# Altium schematic sheet Sheet1.SchDoc
size A1; SheetNumber: 1; SheetTotal: 1
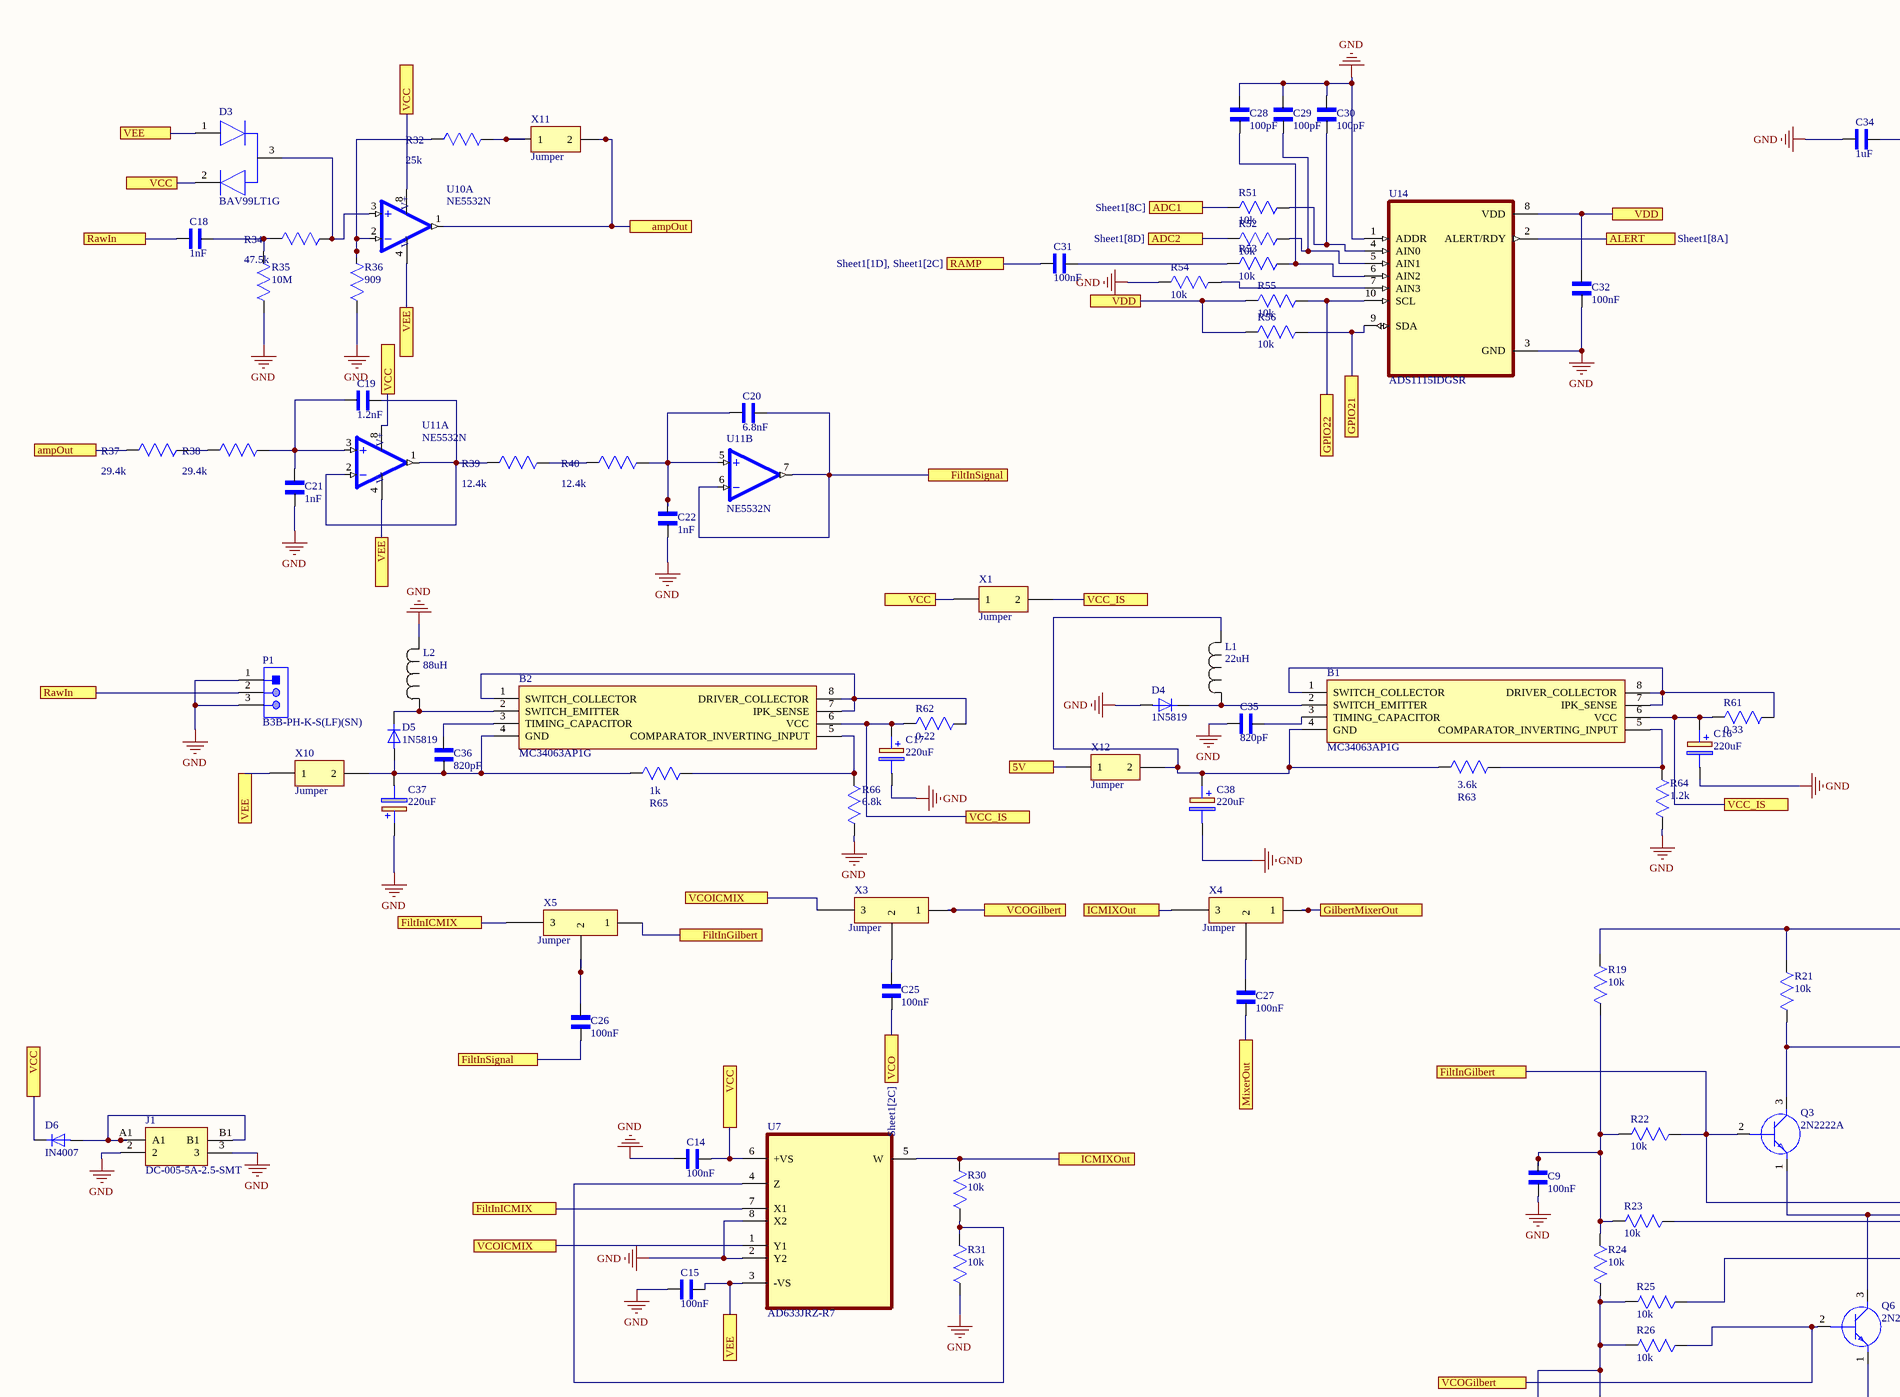
[diagram p0: Sheet1.SchDoc, top left]
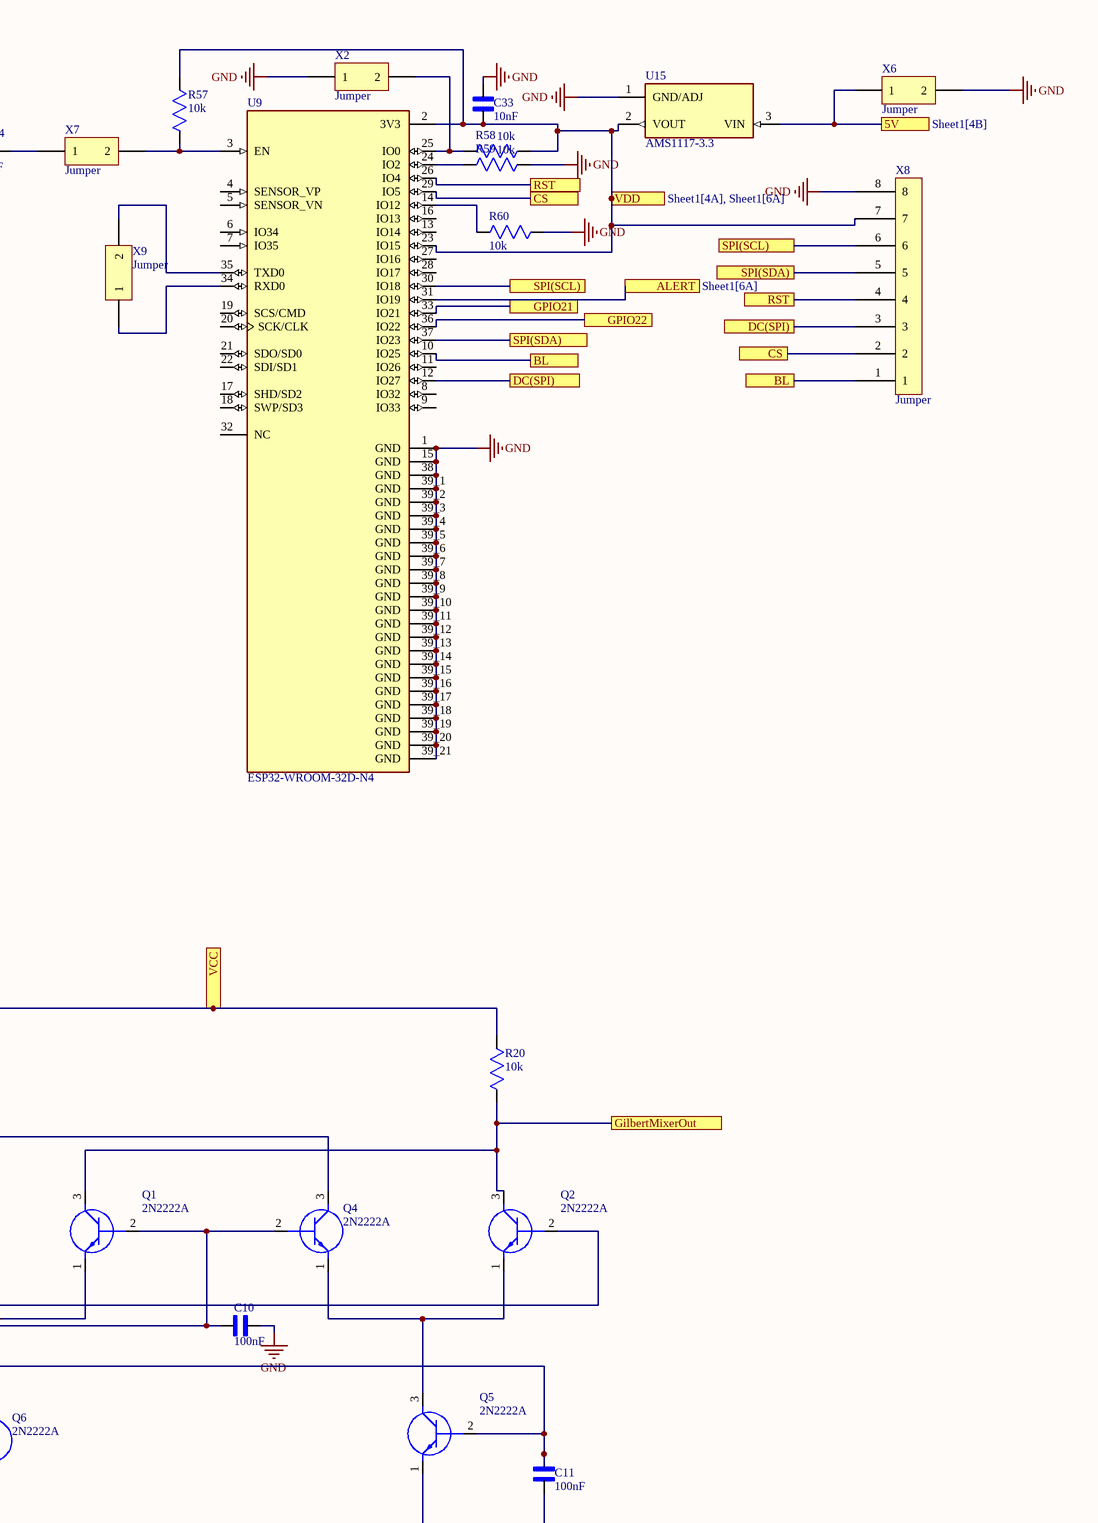
[diagram p1: Sheet1.SchDoc, top right]
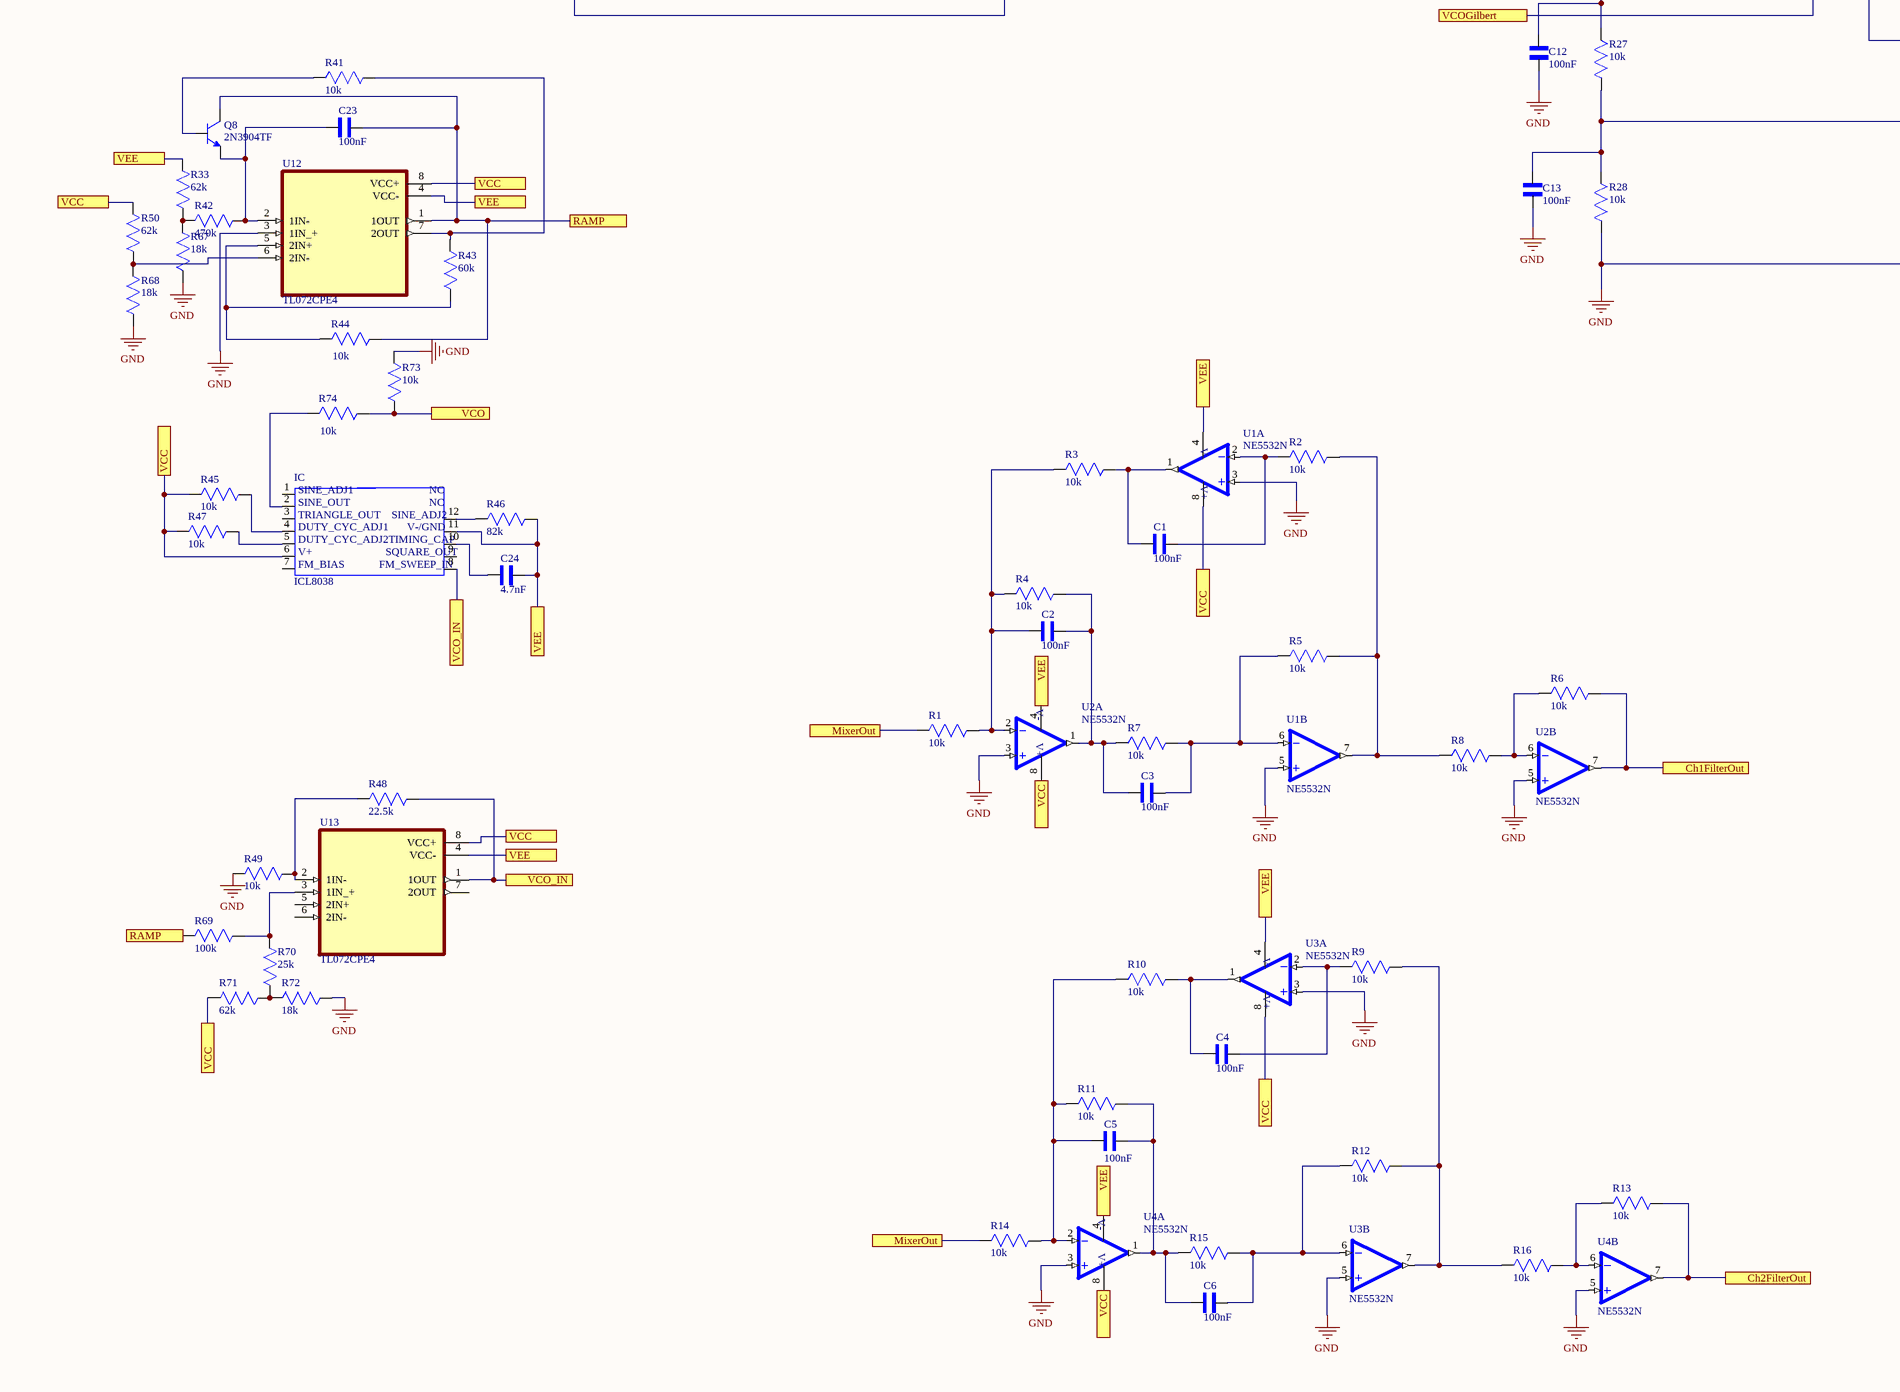
[diagram p2: Sheet1.SchDoc, bottom left]
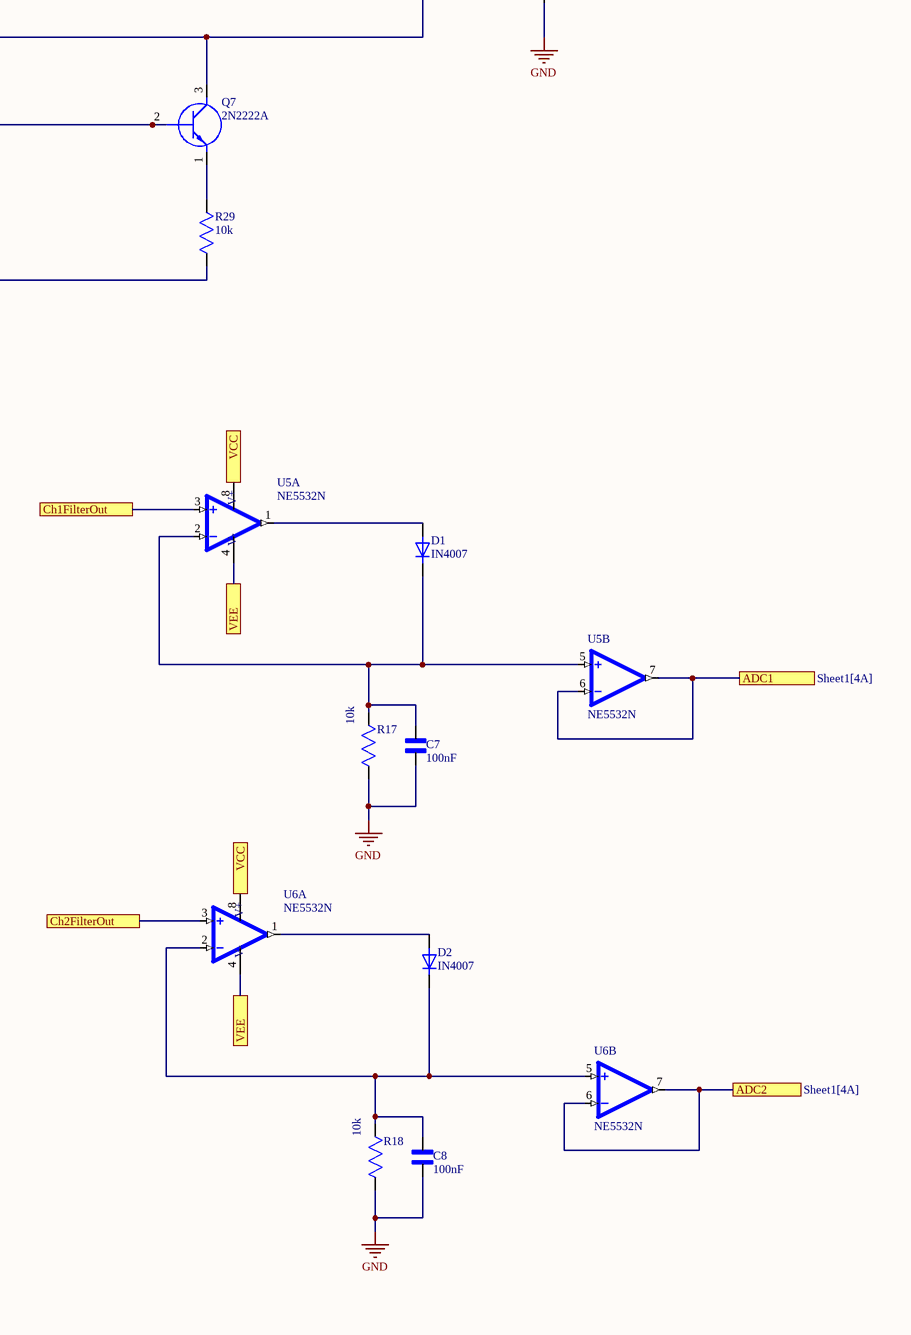
[diagram p3: Sheet1.SchDoc, bottom right]

## Parts
B1  MC34063AP1G  [DIP794W56P254L959H533Q8N]
B2  MC34063AP1G  [DIP794W56P254L959H533Q8N]
C1  100nF  [CAPC2012X95N]
C2  100nF  [CAPC2012X95N]
C3  100nF  [CAPC2012X95N]
C4  100nF  [CAPC2012X95N]
C5  100nF  [CAPC2012X95N]
C6  100nF  [CAPC2012X95N]
C7  100nF  [CAPC2012X95N]
C8  100nF  [CAPC2012X95N]
C9  100nF  [CAPC2012X95N]
C10  100nF  [CAPC2012X95N]
C11  100nF  [CAPC2012X95N]
C12  100nF  [CAPC2012X95N]
C13  100nF  [CAPC2012X95N]
C14  100nF  [CAPC2012X95N]
C15  100nF  [CAPC2012X95N]
C16  220uF  [CAPAE660X800N]
C17  220uF  [CAPAE660X800N]
C18  1nF  [CAPC2012X95N]
C19  1.2nF  [CAPC2012X95N]
C20  6.8nF  [CAPC2012X95N]
C21  1nF  [CAPC2012X95N]
C22  1nF  [CAPC2012X95N]
C23  100nF  [CAPC2012X95N]
C24  4.7nF  [CAPC2012X95N]
C25  100nF  [CAPC2012X95N]
C26  100nF  [CAPC2012X95N]
C27  100nF  [CAPC2012X95N]
C28  100pF  [CAPC2012X95N]
C29  100pF  [CAPC2012X95N]
C30  100pF  [CAPC2012X95N]
C31  100nF  [CAPC2012X95N]
C32  100nF  [CAPC2012X95N]
C33  10nF  [CAPC2012X95N]
C34  1uF  [CAPC2012X95N]
C35  820pF  [CAPC2012X95N]
C36  820pF  [CAPC2012X95N]
C37  220uF  [CAPAE660X800N]
C38  220uF  [CAPAE660X800N]
D1  IN4007  [DIOAD1070W78L470D235P]
D2  IN4007  [DIOAD1070W78L470D235P]
D3  BAV99LT1G  [FP-318-08-IPC_B]
D4  1N5819  [DIOAD1070W78L470D235P]
D5  1N5819  [DIOAD1070W78L470D235P]
D6  IN4007  [DIOAD1070W78L470D235P]
IC  ICL8038  [ICL8038]
J1  DC-005-5A-2.5-SMT  [DC0055A25SMT]
L1  22uH  [IND_BOURNS_SRN6045]
L2  88uH  [IND_BOURNS_SRN6045]
P1  B3B-PH-K-S(LF)(SN)  [JST-B3B-PH-K-S-3_V]
Q1  2N2222A  [2N2222A]
Q2  2N2222A  [2N2222A]
Q3  2N2222A  [2N2222A]
Q4  2N2222A  [2N2222A]
Q5  2N2222A  [2N2222A]
Q6  2N2222A  [2N2222A]
Q7  2N2222A  [2N2222A]
Q8  2N3904TF  [TO92254P520H877-3]
R1  10k  [RC0805N_YAG-M]
R2  10k  [RC0805N_YAG-M]
R3  10k  [RC0805N_YAG-M]
R4  10k  [RC0805N_YAG-M]
R5  10k  [RC0805N_YAG-M]
R6  10k  [RC0805N_YAG-M]
R7  10k  [RC0805N_YAG-M]
R8  10k  [RC0805N_YAG-M]
R9  10k  [RC0805N_YAG-M]
R10  10k  [RC0805N_YAG-M]
R11  10k  [RC0805N_YAG-M]
R12  10k  [RC0805N_YAG-M]
R13  10k  [RC0805N_YAG-M]
R14  10k  [RC0805N_YAG-M]
R15  10k  [RC0805N_YAG-M]
R16  10k  [RC0805N_YAG-M]
R17  10k  [RC0805N_YAG-M]
R18  10k  [RC0805N_YAG-M]
R19  10k  [RC0805N_YAG-M]
R20  10k  [RC0805N_YAG-M]
R21  10k  [RC0805N_YAG-M]
R22  10k  [RC0805N_YAG-M]
R23  10k  [RC0805N_YAG-M]
R24  10k  [RC0805N_YAG-M]
R25  10k  [RC0805N_YAG-M]
R26  10k  [RC0805N_YAG-M]
R27  10k  [RC0805N_YAG-M]
R28  10k  [RC0805N_YAG-M]
R29  10k  [RC0805N_YAG-M]
R30  10k  [RC0805N_YAG-M]
R31  10k  [RC0805N_YAG-M]
R32  25k  [RC0805N_YAG-M]
R33  62k  [RC0805N_YAG-M]
R34  47.5k  [RC0805N_YAG-M]
R35  10M  [RC0805N_YAG-M]
R36  909  [RC0805N_YAG-M]
R37  29.4k  [RC0805N_YAG-M]
R38  29.4k  [RC0805N_YAG-M]
R39  12.4k  [RC0805N_YAG-M]
R40  12.4k  [RC0805N_YAG-M]
R41  10k  [RC0805N_YAG-M]
R42  470k  [RC0805N_YAG-M]
R43  60k  [RC0805N_YAG-M]
R44  10k  [RC0805N_YAG-M]
R45  10k  [RC0805N_YAG-M]
R46  82k  [RC0805N_YAG-M]
R47  10k  [RC0805N_YAG-M]
R48  22.5k  [RC0805N_YAG-M]
R49  10k  [RC0805N_YAG-M]
R50  62k  [RC0805N_YAG-M]
R51  10k  [RC0805N_YAG-M]
R52  10k  [RC0805N_YAG-M]
R53  10k  [RC0805N_YAG-M]
R54  10k  [RC0805N_YAG-M]
R55  10k  [RC0805N_YAG-M]
R56  10k  [RC0805N_YAG-M]
R57  10k  [RC0805N_YAG-M]
R58  10k  [RC0805N_YAG-M]
R59  10k  [RC0805N_YAG-M]
R60  10k  [RC0805N_YAG-M]
R61  0.33  [RES_BPR56_5W_10MM_VERTICAL.]
R62  0.22  [RES_BPR56_5W_10MM_VERTICAL.]
R63  3.6k  [RC0805N_YAG-M]
R64  1.2k  [RC0805N_YAG-M]
R65  1k  [RC0805N_YAG-M]
R66  6.8k  [RC0805N_YAG-M]
R67  18k  [RC0805N_YAG-M]
R68  18k  [RC0805N_YAG-M]
R69  100k  [RC0805N_YAG-M]
R70  25k  [RC0805N_YAG-M]
R71  62k  [RC0805N_YAG-M]
R72  18k  [RC0805N_YAG-M]
R73  10k  [RC0805N_YAG-M]
R74  10k  [RC0805N_YAG-M]
U1  NE5532N  [DIP766W45P254L1016H533Q8]  (parts A,B of 2)
U2  NE5532N  [DIP766W45P254L1016H533Q8]  (parts A,B of 2)
U3  NE5532N  [DIP766W45P254L1016H533Q8]  (parts A,B of 2)
U4  NE5532N  [DIP766W45P254L1016H533Q8]  (parts A,B of 2)
U5  NE5532N  [DIP766W45P254L1016H533Q8]  (parts A,B of 2)
U6  NE5532N  [DIP766W45P254L1016H533Q8]  (parts A,B of 2)
U7  AD633JRZ-R7  [SOIC127P600X175-8N]
U9  ESP32-WROOM-32D-N4  [MODULE_ESP32-WROOM-32D-N4]
U10  NE5532N  [DIP766W45P254L1016H533Q8]  (part A of 2)
U11  NE5532N  [DIP766W45P254L1016H533Q8]  (parts A,B of 2)
U12  TL072CPE4  [DIP794W45P254L959H508Q8]
U13  TL072CPE4  [DIP794W45P254L959H508Q8]
U14  ADS1115IDGSR  [SOP50P490X110-10N]
U15  AMS1117-3.3  [SOT229P700X180-4N]
X1  Jumper  [CON_JUMPER_2POL]
X2  Jumper  [CON_JUMPER_2POL]
X3  Jumper  [CON_JUMPER_3POL]
X4  Jumper  [CON_JUMPER_3POL]
X5  Jumper  [CON_JUMPER_3POL]
X6  Jumper  [CON_JUMPER_2POL]
X7  Jumper  [CON_JUMPER_2POL]
X8  Jumper  [CON_JUMPER_8POL_LINEAR]
X9  Jumper  [CON_JUMPER_2POL]
X10  Jumper  [CON_JUMPER_2POL]
X11  Jumper  [CON_JUMPER_2POL]
X12  Jumper  [CON_JUMPER_2POL]

## Ports
5V (see Sheet1[4B]), 5V (see Sheet1[9A]), ADC1 (see Sheet1[4A]), ADC1 (see Sheet1[8C]), ADC2 (see Sheet1[4A]), ADC2 (see Sheet1[8D]), ALERT (see Sheet1[6A]), ALERT (see Sheet1[8A]), ampOut (see Sheet1[1A]), ampOut (see Sheet1[3A]), BL (see Sheet1[8A]), Ch1FilterOut (see Sheet1[6D]), Ch1FilterOut (see Sheet1[7C]), Ch2FilterOut (see Sheet1[6D]), Ch2FilterOut (see Sheet1[7D]), CS (see Sheet1[8A]), DC(SPI) (see Sheet1[8A]), FiltInGilbert (see Sheet1[3B]), FiltInGilbert (see Sheet1[5B]), FiltInICMIX (see Sheet1[2B]), FiltInSignal (see Sheet1[2B]), FiltInSignal (see Sheet1[4A]), GilbertMixerOut (see Sheet1[5B]), GilbertMixerOut (see Sheet1[8B]), GPIO21 (see Sheet1[5A]), GPIO21 (see Sheet1[8A]), GPIO22 (see Sheet1[5A]), GPIO22 (see Sheet1[8A]), ICMIXOut (see Sheet1[4B]), MixerOut (see Sheet1[3D]), MixerOut (see Sheet1[3D], Sheet1[4B]), RAMP (see Sheet1[1D], Sheet1[2C]), RAMP (see Sheet1[1D], Sheet1[4A]), RAMP (see Sheet1[2C], Sheet1[4A]), RawIn (see Sheet1[1A]), RST (see Sheet1[8A]), SPI(SCL) (see Sheet1[8A]), SPI(SDA) (see Sheet1[8A]), VCC (see Sheet1[1A], Sheet1[1B], Sheet1[1C], Sheet1[1D], Sheet1[2A], Sheet1[2C], Sheet1[2D], Sheet1[3A], Sheet1[3B], Sheet1[4C], Sheet1[4D], Sheet1[5D], Sheet1[7B], Sheet1[7C]), VCC (see Sheet1[1A], Sheet1[1B], Sheet1[1C], Sheet1[1D], Sheet1[2A], Sheet1[2C], Sheet1[2D], Sheet1[3A], Sheet1[3B], Sheet1[4C], Sheet1[4D], Sheet1[5D], Sheet1[7B], Sheet1[7C], Sheet1[7D]), VCC (see Sheet1[1A], Sheet1[1B], Sheet1[1C], Sheet1[1D], Sheet1[2A], Sheet1[2C], Sheet1[2D], Sheet1[3A], Sheet1[3B], Sheet1[4C], Sheet1[4D], Sheet1[5D], Sheet1[7B], Sheet1[7D]), VCC (see Sheet1[1A], Sheet1[1B], Sheet1[1C], Sheet1[1D], Sheet1[2A], Sheet1[2C], Sheet1[2D], Sheet1[3A], Sheet1[3B], Sheet1[4C], Sheet1[4D], Sheet1[5D], Sheet1[7C], Sheet1[7D]), VCC (see Sheet1[1A], Sheet1[1B], Sheet1[1C], Sheet1[1D], Sheet1[2A], Sheet1[2C], Sheet1[2D], Sheet1[3A], Sheet1[3B], Sheet1[4C], Sheet1[4D], Sheet1[7B], Sheet1[7C], Sheet1[7D]), VCC (see Sheet1[1A], Sheet1[1B], Sheet1[1C], Sheet1[1D], Sheet1[2A], Sheet1[2C], Sheet1[2D], Sheet1[3A], Sheet1[3B], Sheet1[4D], Sheet1[5D], Sheet1[7B], Sheet1[7C], Sheet1[7D]), VCC (see Sheet1[1A], Sheet1[1B], Sheet1[1C], Sheet1[1D], Sheet1[2A], Sheet1[2C], Sheet1[2D], Sheet1[3A], Sheet1[4C], Sheet1[4D], Sheet1[5D], Sheet1[7B], Sheet1[7C], Sheet1[7D]), VCC (see Sheet1[1A], Sheet1[1B], Sheet1[1C], Sheet1[1D], Sheet1[2A], Sheet1[2C], Sheet1[2D], Sheet1[3B], Sheet1[4C], Sheet1[4D], Sheet1[5D], Sheet1[7B], Sheet1[7C], Sheet1[7D]), VCC (see Sheet1[1A], Sheet1[1B], Sheet1[1C], Sheet1[1D], Sheet1[2A], Sheet1[2C], Sheet1[3A], Sheet1[3B], Sheet1[4C], Sheet1[4D], Sheet1[5D], Sheet1[7B], Sheet1[7C], Sheet1[7D]), VCC (see Sheet1[1A], Sheet1[1B], Sheet1[1C], Sheet1[1D], Sheet1[2A], Sheet1[2D], Sheet1[3A], Sheet1[3B], Sheet1[4C], Sheet1[4D], Sheet1[5D], Sheet1[7B], Sheet1[7C], Sheet1[7D]), VCC (see Sheet1[1A], Sheet1[1B], Sheet1[1C], Sheet1[2A], Sheet1[2C], Sheet1[2D], Sheet1[3A], Sheet1[3B], Sheet1[4C], Sheet1[4D], Sheet1[5D], Sheet1[7B], Sheet1[7C], Sheet1[7D]), VCC (see Sheet1[1A], Sheet1[1C], Sheet1[1D], Sheet1[2A], Sheet1[2C], Sheet1[2D], Sheet1[3A], Sheet1[3B], Sheet1[4C], Sheet1[4D], Sheet1[5D], Sheet1[7B], Sheet1[7C], Sheet1[7D]), VCC (see Sheet1[1B], Sheet1[1C], Sheet1[1D], Sheet1[2A], Sheet1[2C], Sheet1[2D], Sheet1[3A], Sheet1[3B], Sheet1[4C], Sheet1[4D], Sheet1[5D], Sheet1[7B], Sheet1[7C], Sheet1[7D]), VCC_IS (see Sheet1[4A], Sheet1[4B]), VCC_IS (see Sheet1[4A], Sheet1[6B]), VCC_IS (see Sheet1[4B], Sheet1[6B]), VCO (see Sheet1[2C]), VCO (see Sheet1[3B]), VCO_IN (see Sheet1[2C]), VCO_IN (see Sheet1[2D]), VCOGilbert (see Sheet1[4B]), VCOGilbert (see Sheet1[5B]), VCOICMIX (see Sheet1[2B]), VCOICMIX (see Sheet1[3B]), VDD (see Sheet1[4A], Sheet1[6A]), VDD (see Sheet1[4A], Sheet1[8A]), VDD (see Sheet1[6A], Sheet1[8A]), VEE (see Sheet1[1A], Sheet1[1B], Sheet1[1C], Sheet1[2A], Sheet1[2C], Sheet1[2D], Sheet1[3B], Sheet1[4C], Sheet1[4D], Sheet1[5D], Sheet1[7C]), VEE (see Sheet1[1A], Sheet1[1B], Sheet1[1C], Sheet1[2A], Sheet1[2C], Sheet1[2D], Sheet1[3B], Sheet1[4C], Sheet1[4D], Sheet1[5D], Sheet1[7C], Sheet1[7D]), VEE (see Sheet1[1A], Sheet1[1B], Sheet1[1C], Sheet1[2A], Sheet1[2C], Sheet1[2D], Sheet1[3B], Sheet1[4C], Sheet1[4D], Sheet1[5D], Sheet1[7D]), VEE (see Sheet1[1A], Sheet1[1B], Sheet1[1C], Sheet1[2A], Sheet1[2C], Sheet1[2D], Sheet1[3B], Sheet1[4C], Sheet1[4D], Sheet1[7C], Sheet1[7D]), VEE (see Sheet1[1A], Sheet1[1B], Sheet1[1C], Sheet1[2A], Sheet1[2C], Sheet1[2D], Sheet1[3B], Sheet1[4C], Sheet1[5D], Sheet1[7C], Sheet1[7D]), VEE (see Sheet1[1A], Sheet1[1B], Sheet1[1C], Sheet1[2A], Sheet1[2C], Sheet1[2D], Sheet1[4C], Sheet1[4D], Sheet1[5D], Sheet1[7C], Sheet1[7D]), VEE (see Sheet1[1A], Sheet1[1B], Sheet1[1C], Sheet1[2A], Sheet1[2C], Sheet1[3B], Sheet1[4C], Sheet1[4D], Sheet1[5D], Sheet1[7C], Sheet1[7D]), VEE (see Sheet1[1A], Sheet1[1B], Sheet1[2A], Sheet1[2C], Sheet1[2D], Sheet1[3B], Sheet1[4C], Sheet1[4D], Sheet1[5D], Sheet1[7C], Sheet1[7D]), VEE (see Sheet1[1A], Sheet1[1C], Sheet1[2A], Sheet1[2C], Sheet1[2D], Sheet1[3B], Sheet1[4C], Sheet1[4D], Sheet1[5D], Sheet1[7C], Sheet1[7D]), VEE (see Sheet1[1B], Sheet1[1C], Sheet1[2A], Sheet1[2C], Sheet1[2D], Sheet1[3B], Sheet1[4C], Sheet1[4D], Sheet1[5D], Sheet1[7C], Sheet1[7D])

## Nets
GND: C7.2 C8.2 C9.2 C10.1 C11.1 C12.2 C13.2 C14.1 C15.1 C16.2(-) C17.2(-) C21.1 C22.1 C28.2 C29.2 C30.2 C32.1 C33.2 C34.2 C35.2 C37.1(+) C38.2(-) D4.A J1.2 J1.3 L2.1 P1.1 P1.3 R17.1 R18.1 R28.1 R29.1 R31.2 R35.2 R36.2 R49.2 R54.2 R59.1 R60.1 R64.1 R66.1 R67.2 R68.2 R72.2 R73.1 U1.3(+INA) U1.5(+INB) U2.3(+INA) U2.5(+INB) U3.3(+INA) U3.5(+INB) U4.3(+INA) U4.5(+INB) U7.2(Y2) U7.8(X2) U9.1(GND) U9.15(GND) U9.38(GND) U9.39_1(GND) U9.39_2(GND) U9.39_3(GND) U9.39_4(GND) U9.39_5(GND) U9.39_6(GND) U9.39_7(GND) U9.39_8(GND) U9.39_9(GND) U9.39_10(GND) U9.39_11(GND) U9.39_12(GND) U9.39_13(GND) U9.39_14(GND) U9.39_15(GND) U9.39_16(GND) U9.39_17(GND) U9.39_18(GND) U9.39_19(GND) U9.39_20(GND) U9.39_21(GND) U12.3(1IN_+) U14.1(ADDR) U14.3(GND) U15.1(GND/ADJ) X2.1 X6.2 X8.8
5V: U15.3(VIN) X6.1 X12.1 ; port 5V
ADC1: R51.2 U5.6(-INB) U5.7(OUTB) ; port ADC1
ADC2: R52.2 U6.6(-INB) U6.7(OUTB) ; port ADC2
ALERT: U9.31(IO19) U14.2(ALERT/RDY) ; port ALERT
ampOut: R37.2 U10.1(OUTA) X11.2 ; port ampOut
BL: U9.10(IO25) X8.1 ; port BL
Ch1FilterOut: R6.1 U2.7(OUTB) U5.3(+INA) ; port Ch1FilterOut
Ch2FilterOut: R13.1 U4.7(OUTB) U6.3(+INA) ; port Ch2FilterOut
CS: U9.29(IO5) X8.2 ; port CS
DC(SPI): U9.12(IO27) X8.3 ; port DC(SPI)
FiltInGilbert: Q2.2(B) Q3.2(B) R22.2 X5.1 ; port FiltInGilbert
FiltInICMIX: U7.7(X1) X5.3 ; port FiltInICMIX
FiltInSignal: C20.2 C26.2 U11.6(-INB) U11.7(OUTB) ; port FiltInSignal
GilbertMixerOut: Q1.3(C) Q2.3(C) R20.1 X4.1 ; port GilbertMixerOut
GPIO21: R56.1 U9.33(IO21) U14.9(SDA) ; port GPIO21
GPIO22: R55.1 U9.36(IO22) U14.10(SCL) ; port GPIO22
ICMIXOut: R30.1 U7.5(W) X4.3 ; port ICMIXOut
MixerOut: C27.2 R1.2 R14.2 ; port MixerOut
RAMP: C23.2 C31.1 Q8.3(C) R44.1 R69.2 U12.1(1OUT) ; port RAMP
RawIn: C18.2 P1.2 ; port RawIn
RST: U9.26(IO4) X8.4 ; port RST
SPI(SCL): U9.30(IO18) X8.6 ; port SPI(SCL)
SPI(SDA): U9.37(IO23) X8.5 ; port SPI(SDA)
VCC: C14.2 D3.2(C) D6.C IC.6 R19.2 R20.2 R21.2 R45.2 R47.2 R50.1 R71.1 U1.8(V+) U2.8(V+) U3.8(V+) U4.8(V+) U5.8(V+) U6.8(V+) U7.6(+VS) U10.8(V+) U11.8(V+) U12.8(VCC+) U13.8(VCC+) X1.1 ; port VCC
VCC_IS: B1.6(VCC) B2.6(VCC) C16.1(+) C17.1(+) R61.2 R62.2 X1.2 ; port VCC_IS
VCO: C25.2 R73.2 R74.1 ; port VCO
VCO_IN: IC.8 R48.1 U13.1(1OUT) ; port VCO_IN
VCOGilbert: Q6.2(B) R26.2 X3.1 ; port VCOGilbert
VCOICMIX: U7.1(Y1) X3.3 ; port VCOICMIX
VDD: C32.2 C33.1 R55.2 R56.2 R57.1 R58.1 U9.2(3V3) U9.23(IO15) U14.8(VDD) U15.2(VOUT) X8.7 ; port VDD
VEE: C15.2 C24.2 D3.1(A) IC.11 R33.1 R46.1 U1.4(V-) U2.4(V-) U3.4(V-) U4.4(V-) U5.4(V-) U6.4(V-) U7.3(-VS) U10.4(V-) U11.4(V-) U12.4(VCC-) U13.4(VCC-) X10.1 ; port VEE
NetB1_1: B1.1(SWITCH_COLLECTOR) B1.7(IPK_SENSE) B1.8(DRIVER_COLLECTOR) R61.1
NetB1_2: B1.2(SWITCH_EMITTER) D4.C L1.2
NetB1_3: B1.3(TIMING_CAPACITOR) C35.1
NetB1_4: B1.4(GND) C38.1(+) L1.1 R63.2 X12.2
NetB1_5: B1.5(COMPARATOR_INVERTING_INPUT) R63.1 R64.2
NetB2_1: B2.1(SWITCH_COLLECTOR) B2.7(IPK_SENSE) B2.8(DRIVER_COLLECTOR) R62.1
NetB2_2: B2.2(SWITCH_EMITTER) D5.C L2.2
NetB2_3: B2.3(TIMING_CAPACITOR) C36.1
NetB2_4: B2.4(GND) C36.2 C37.2(-) D5.A R65.2 X10.2
NetB2_5: B2.5(COMPARATOR_INVERTING_INPUT) R65.1 R66.2
NetC1_1: C1.1 R3.1 U1.1(OUTA)
NetC1_2: C1.2 R2.2 U1.2(-INA)
NetC2_1: C2.1 R1.1 R3.2 R4.2 U2.2(-INA)
NetC2_2: C2.2 C3.1 R4.1 R7.2 U2.1(OUTA)
NetC3_2: C3.2 R5.2 R7.1 U1.6(-INB)
NetC4_1: C4.1 R10.1 U3.1(OUTA)
NetC4_2: C4.2 R9.2 U3.2(-INA)
NetC5_1: C5.1 R10.2 R11.2 R14.1 U4.2(-INA)
NetC5_2: C5.2 C6.1 R11.1 R15.2 U4.1(OUTA)
NetC6_2: C6.2 R12.2 R15.1 U3.6(-INB)
NetC7_1: C7.1 D1.C R17.2 U5.2(-INA) U5.5(+INB)
NetC8_1: C8.1 D2.C R18.2 U6.2(-INA) U6.5(+INB)
NetC9_1: C9.1 R19.1 R22.1 R23.1 R24.2
NetC10_2: C10.2 Q1.2(B) Q4.2(B) R23.2
NetC11_2: C11.2 Q5.2(B) R25.2
NetC12_1: C12.1 R24.1 R25.1 R26.1 R27.2
NetC13_1: C13.1 Q7.2(B) R27.1 R28.2
NetC18_1: C18.1 R34.2 R35.1
NetC19_1: C19.1 C21.2 R38.1 U11.3(+INA)
NetC19_2: C19.2 R39.2 U11.1(OUTA) U11.2(-INA)
NetC20_1: C20.1 C22.2 R40.1 U11.5(+INB)
NetC23_1: C23.1 Q8.1(E) R42.1 U12.2(1IN-)
NetC24_1: C24.1 IC.10
NetC25_1: C25.1 X3.2
NetC26_1: C26.1 X5.2
NetC27_1: C27.1 X4.2
NetC28_1: C28.1 R53.1 U14.6(AIN2)
NetC29_1: C29.1 R52.1 U14.5(AIN1)
NetC30_1: C30.1 R51.1 U14.4(AIN0)
NetC31_2: C31.2 R53.2
NetC34_1: C34.1 X7.1
NetD1_A: D1.A U5.1(OUTA)
NetD2_A: D2.A U6.1(OUTA)
NetD3_3: D3.3(CATHODE/ANODE) R34.1 U10.3(+INA)
NetD6_A: D6.A J1.A1 J1.B1
NetIC_2: IC.2 R74.2
NetIC_4: IC.4 R45.1
NetIC_5: IC.5 R47.1
NetIC_12: IC.12 R46.2
NetQ1_1: Q1.1(E) Q3.1(E) Q6.3(C)
NetQ2_1: Q2.1(E) Q4.1(E) Q5.3(C)
NetQ3_3: Q3.3(C) Q4.3(C) R21.1
NetQ5_1: Q5.1(E) Q6.1(E) Q7.3(C)
NetQ7_1: Q7.1(E) R29.2
NetQ8_2: Q8.2(B) R41.2
NetR2_1: R2.1 R5.1 R8.2 U1.7(OUTB)
NetR6_2: R6.2 R8.1 U2.6(-INB)
NetR9_1: R9.1 R12.1 R16.2 U3.7(OUTB)
NetR13_2: R13.2 R16.1 U4.6(-INB)
NetR30_2: R30.2 R31.1 U7.4(Z)
NetR32_1: R32.1 X11.1
NetR32_2: R32.2 R36.1 U10.2(-INA)
NetR33_2: R33.2 R42.2 R67.1
NetR37_1: R37.1 R38.2
NetR39_1: R39.1 R40.2
NetR41_1: R41.1 R43.1 U12.7(2OUT)
NetR43_2: R43.2 R44.2 U12.5(2IN+)
NetR48_2: R48.2 R49.1 U13.2(1IN-)
NetR50_2: R50.2 R68.1 U12.6(2IN-)
NetR54_1: R54.1 U14.7(AIN3)
NetR57_2: R57.2 U9.3(EN) X7.2
NetR58_2: R58.2 U9.25(IO0) X2.2
NetR59_2: R59.2 U9.24(IO2)
NetR60_2: R60.2 U9.14(IO12)
NetR69_1: R69.1 R70.1 U13.3(1IN_+)
NetR70_2: R70.2 R71.2 R72.1
NetU9_34: U9.34(RXD0) X9.1
NetU9_35: U9.35(TXD0) X9.2

Not connected (* = marked no-connect by the designer): IC 1 3 7 9; U9 4(SENSOR_VP) 5(SENSOR_VN) 6(IO34) 7(IO35) 8(IO32) 9(IO33) 11(IO26) 13(IO14) 16(IO13) 17(SHD/SD2) 18(SWP/SD3) 19(SCS/CMD) 20(SCK/CLK) 21(SDO/SD0) 22(SDI/SD1) 27(IO16) 28(IO17) 32(NC); U13 5(2IN+) 6(2IN-) 7(2OUT)

## Notes on the sheet
- (in symbol ICL8038) SINE_ADJ1; NC; SINE_OUT; TRIANGLE_OUT; SINE_ADJ2; DUTY_CYC_ADJ1; V-/GND; DUTY_CYC_ADJ2; TIMING_CAP; V+; SQUARE_OUT; FM_BIAS; FM_SWEEP_IN

## Library data of the parts
B1 B2 = MC34063AP1G: Low Standby Current; Output Voltage Adjustable; Precision 2% Reference; Operation from 3.0 V to 40 V Input; Current Limiting; Frequency Operation to 100 kHz; Output Switch Current to 1.5 A; MC34063A = 0 to +70; MC33063A = -40 to +85; MC33063AV / NCV33063A = -40 to +125; 4x4mm DFN package option; Manufacturer_Name: onsemi; Geometry.Height: 5.33mm; Manufacturer_Part_Number: MC34063AP1G; Mouser Part Number: 863-MC34063AP1G; Mouser Price/Stock: https://www.mouser.co.uk/ProductDetail/onsemi/MC34063AP1G?qs=dFKnUM%2FquJaLwjzEV8VjCA%3D%3D; Arrow Part Number: MC34063AP1G; Arrow Price/Stock: https://www.arrow.com/en/products/mc34063ap1g/on-semiconductor?utm_currency=USD&region=europe; Datasheet Link: https://www.onsemi.com/pub/Collateral/MC34063A-D.PDF
C1-C15 C18-C27 = CAP_0805_GENERIC: 0.1 ÂµF Â±10% 50V Ceramic Capacitor X7R 0805 (2012 Metric); MF: Samsung Electro-Mechanics; MP: CL21B104KBCNNNC; SnapEDA_Link: https://www.snapeda.com/parts/CL21B104KBCNNNC/Samsung/view-part/?ref=snap; Package: SMD-2 Samsung; Check_prices: https://www.snapeda.com/parts/CL21B104KBCNNNC/Samsung/view-part/?ref=eda; Voltage: 50V
  C1-C15 C23 C25-C27: Value: 100nF
  C18 C21 C22: Value: 1nF
  C19: Value: 1.2nF
  C20: Value: 6.8nF
  C24: Value: 4.7nF
C16 C17 C37 C38 = UUD1C221MCL1GS: Nichicon 220uF 16 V Aluminium Electrolytic Capacitor, UD Series 2000h 6.3 Dia. x 7.7mm; Geometry.Height: 8mm; Manufacturer_Name: Nichicon; Manufacturer_Part_Number: UUD1C221MCL1GS; Mouser Part Number: 647-UUD1C221MCL; Mouser Price/Stock: https://www.mouser.co.uk/ProductDetail/Nichicon/UUD1C221MCL1GS?qs=BJlw7L4Cy78LNN5S2Zav%252BA%3D%3D; Arrow Part Number: UUD1C221MCL1GS; Arrow Price/Stock: https://www.arrow.com/en/products/uud1c221mcl1gs/nichicon?utm_currency=USD&region=nac; Datasheet Link: http://www.mouser.com/datasheet/2/293/e-uud-1513238.pdf
C28-C32 = CAP_0805_GENERIC: 0.1 ÂµF Â±10% 50V Ceramic Capacitor X7R 0805 (2012 Metric); Value: 1nF; MF: Samsung Electro-Mechanics; MP: CL21B104KBCNNNC; Package: SMD-2 Samsung; SnapEDA_Link: https://www.snapeda.com/parts/CL21B104KBCNNNC/Samsung/view-part/?ref=snap; Check_prices: https://www.snapeda.com/parts/CL21B104KBCNNNC/Samsung/view-part/?ref=eda; Voltage: 50V
C33-C36 = CAP_0805_GENERIC: 0.1 ÂµF Â±10% 50V Ceramic Capacitor X7R 0805 (2012 Metric); Value: 100nF; MF: Samsung Electro-Mechanics; MP: CL21B104KBCNNNC; SnapEDA_Link: https://www.snapeda.com/parts/CL21B104KBCNNNC/Samsung/view-part/?ref=snap; Package: SMD-2 Samsung; Check_prices: https://www.snapeda.com/parts/CL21B104KBCNNNC/Samsung/view-part/?ref=eda; Voltage: 50V
D1 D2 D4-D6 = IN4007: Diode Standard 1000 V 1A Through Hole DO-204AL (DO-41); MF: Vishay Semiconductor; SnapEDA_Link: https://www.snapeda.com/parts/IN4007/Vishay/view-part/?ref=snap; Package: DO-41 Vishay Semiconductor; Value: *; MP: IN4007; Check_prices: https://www.snapeda.com/parts/IN4007/Vishay/view-part/?ref=eda
D3 = CMP-07163-000036-1: DIODE ARRAY 100V 215MA SOT23-3; Capacitance: 1.5pF; Current Rating: 200mA; Max Repetitive Reverse Voltage (Vrrm): 70V; Forward Voltage: 1.25V; Max Forward Surge Current (Ifsm): 500mA; Peak Reverse Current: 2.5uA; Forward Current: 150mA; Peak Non-Repetitive Surge Current: 2A; Reverse Recovery Time: 6ns; Length: 2.9mm; Voltage Rating (DC): 70V; Case/Package: SOT-23; Height: 0.94mm; Number of Pins: 3; Mount: Surface Mount; Min Operating Temperature: -65°C; Lead Free: Lead Free; REACH SVHC: No SVHC; Width: 1.3mm; Packaging: Tape and Reel; Max Operating Temperature: 150°C
IC = ICL8038: IC OSCILL GEN/VOLT CONTROL 14DIP; MF: Renesas Electronics; Value: *; Price: None; MP: ICL8038; Availability: Unavailable; SnapEDA_Link: https://www.snapeda.com/parts/ICL8038/Renesas%20Electronics%20America%20Inc./view-part/1764984/?ref=snap; Package: None
J1 = DC-005-5A-2.5-SMT: DC Power Jack; Manufacturer_Name: XKB Connectivity; Geometry.Height: 11mm; Manufacturer_Part_Number: DC-005-5A-2.5-SMT; Mouser Part Number: *; Mouser Price/Stock: *; Arrow Part Number: *; Arrow Price/Stock: *; Datasheet Link: https://datasheet.lcsc.com/szlcsc/XKB-DC-005-5A-2-5-SMT_C319133.pdf
L1 L2 = IND_SRN6045_GENERIC: Description; Manufacturer_Name: Bourns Electronics; Manufacturer_Part_Number: SRN6045-100M; Value: 10uH; Current: 3A; Copyright: Copyright (C) 2026 Ultra Librarian. All rights reserved.
P1 = CMP-2000-05164-1: Male Header, Pitch 2 mm, 1 x 3 Position, Height 6 mm, Tail Length 3.4 mm, -25 to 85 degC, RoHS, Bulk; Manufacturer: JST; Style/Orientation: StraightHeader/Plug; Pitch: 2mm; No of Positions: 3; Termination: Crimp; Manufacturer URL: http://www.jst.com/home2.html; Datasheet Version: Oct-06; Type: ShroudedHeader; Datasheet URL: https://datasheet.ciiva.com/11746/0900766b80826550-11746939.pdf
Q1-Q7 = 2N2222A: Transistor BJT NPN; Manufacturer_Name: Diotec; Datasheet Link: https://diotec.com/request/datasheet/2n2222a.pdf; Height: 7.5mm; Manufacturer_Part_Number: 2N2222A; Mouser Part Number: 637-2N2222A; Mouser Price/Stock: https://www.mouser.co.uk/ProductDetail/Diotec-Semiconductor/2N2222A?qs=OlC7AqGiEDmNlRSTGL2dYg%3D%3D; Arrow Part Number: 2N2222A; Arrow Price/Stock: https://www.arrow.com/en/products/2n2222a/diotec-semiconductor-ag
Q8 = 2N3904TF: Transistor General Purpose BJT NPN 40 Volt 0.2 Amp 3-Pin TO-92 Tape And Reel; MF: Fairchild Semiconductor; SnapEDA_Link: https://www.snapeda.com/parts/2N3904TF/Fairchild+Imaging/view-part/?ref=snap; Package: TO-92-3 ON Semiconductor; Value: *; MP: 2N3904TF; Check_prices: https://www.snapeda.com/parts/2N3904TF/Fairchild+Imaging/view-part/?ref=eda
R1-R32 R34-R49 R51-R60 R69 R73 R74 = RES_0805_GENERIC_1: Description; Manufacturer_Name: Yageo; Manufacturer_Part_Number: RC0805FR-0710KL; Copyright: Copyright (C) 2025 Ultra Librarian. All rights reserved.
  R1-R31 R41 R44 R45 R47 R49 R51-R60 R73 R74: Value: 10k
  R32: Value: 25k
  R34: Value: 47.5k
  R35: Value: 10M
  R36: Value: 909
  R37 R38: Value: 29.4k
  R39 R40: Value: 12.4k
  R42: Value: 470k
  R43: Value: 60k
  R46: Value: 82k
  R48: Value: 22.5k
  R69: Value: 100k
R33 R50 R67 R68 R70-R72 = RES_0805_GENERIC_1: Description; Manufacturer_Name: Yageo; Manufacturer_Part_Number: RC0805FR-0710KL; Value: 10k; Copyright: Copyright (C) 2025 Ultra Librarian. All rights reserved.
R61 R62 = RES_BPR56_5W_10MM_VERTICAL: Description; Manufacturer_Name: Yageo; Manufacturer_Part_Number: RC0805FR-0710KL; Value: 10k; Copyright: Copyright (C) 2025 Ultra Librarian. All rights reserved.
R63-R66 = RES_0805_GENERIC_1: Description; Manufacturer_Name: Yageo; Manufacturer_Part_Number: RC0805FR-0710KL; Value: 12.4k; Copyright: Copyright (C) 2025 Ultra Librarian. All rights reserved.
U1-U6 U10 U11 = NE5532N: IC, OP AMP, DUAL; No. of Amplifiers: 2 Amplifier; Bandwidth: 10MHz; Slew Rate: 8V/Âµs; Supply Voltage Range: Â± 15V; Amplifier Case Style: DIP; No. of Pins: 8Pins; Operating Temperature Min: 0Â°C; Operating Temperature Max: 70Â°C; MSL: -; SVHC: No SVHC (1; MF: Fairchild Semiconductor; SnapEDA_Link: https://www.snapeda.com/parts/NE5532N/Fairchild+Imaging/view-part/?ref=snap; Package: PDIP-8 ON Semiconductor; Value: *; MP: NE5532N; Check_prices: https://www.snapeda.com/parts/NE5532N/Fairchild+Imaging/view-part/?ref=eda
U7 = AD633JRZ-R7: Analog Multiplier 4-Quadrant 8-SOIC; MF: Analog Devices; MP: AD633AR; SnapEDA_Link: https://www.snapeda.com/parts/AD633AR/Analog+Devices/view-part/?ref=snap; Package: SOIC-8 Analog Devices; Value: *; Check_prices: https://www.snapeda.com/parts/AD633AR/Analog+Devices/view-part/?ref=eda
U9 = ESP32-WROOM-32D-N4: Bluetooth, WiFi 802.11b/g/n, Bluetooth v4.2 +EDR, Class 1, 2 and 3 Transceiver Module 2.4GHz ~ 2.5GHz Integrated, Trace Surface Mount; MF: Espressif Systems; SnapEDA_Link: https://www.snapeda.com/parts/ESP32-WROOM-32D-N4/Espressif+Systems/view-part/?ref=snap; Package: Non Standard Espressif Systems; Value: *; MP: ESP32-WROOM-32D-N4; Check_prices: https://www.snapeda.com/parts/ESP32-WROOM-32D-N4/Espressif+Systems/view-part/?ref=eda
U12 U13 = TL072CPE4: Dual Low-Noise JFET-Input General-Purpose Operational Amplifier 8-PDIP 0 to 70; MF: Texas Instruments; SnapEDA_Link: https://www.snapeda.com/parts/TL072CPE4/Texas+Instruments/view-part/?ref=snap; Package: PDIP-8 Texas; Value: *; MP: TL072CPE4; Check_prices: https://www.snapeda.com/parts/TL072CPE4/Texas+Instruments/view-part/?ref=eda
U14 = ADS1115IDGSR: 16-bit, 860-SPS, 4-channel, delta-sigma ADC with PGA, oscillator, VREF, comparator and I2C; MF: Texas Instruments; SnapEDA_Link: https://www.snapeda.com/parts/ADS1115IDGSR/Texas+Instruments/view-part/?ref=snap; Package: VSSOP-10 Texas Instruments; Value: *; MP: ADS1115IDGSR; Check_prices: https://www.snapeda.com/parts/ADS1115IDGSR/Texas+Instruments/view-part/?ref=eda
U15 = AMS1117-3.3: LDO Voltage Regulators 800MA LDO LINEAR REG; MF: ams AG; SnapEDA_Link: https://www.snapeda.com/parts/AMS1117-3.3/ams/view-part/?ref=snap; Package: SOT-223 Seeed Technology; Value: *; MP: AMS1117-3.3; Check_prices: https://www.snapeda.com/parts/AMS1117-3.3/ams/view-part/?ref=eda
X1 X2 X6 X7 X9-X12 = CON_JUMPER_2POL: Manufacturer_Name: Yageo; Manufacturer_Part_Number: RC0805FR-0710KL; Value: 10k; Copyright: Copyright (C) 2025 Ultra Librarian. All rights reserved.
X3-X5 = CON_JUMPER_3POL: Manufacturer_Name: Yageo; Manufacturer_Part_Number: RC0805FR-0710KL; Value: 10k; Copyright: Copyright (C) 2025 Ultra Librarian. All rights reserved.
X8 = CON_JUMPER_8POL_LINEAR: Manufacturer_Name: Yageo; Manufacturer_Part_Number: RC0805FR-0710KL; Value: 10k; Copyright: Copyright (C) 2025 Ultra Librarian. All rights reserved.